# Altium schematic sheet 06_ACTUACION.SchDoc: Actuación: PhotoMOS K1 al EVSE
size 420 x 297 mm; Address1: Hardware en IoT · 2026; SheetNumber: 6; SheetTotal: 6
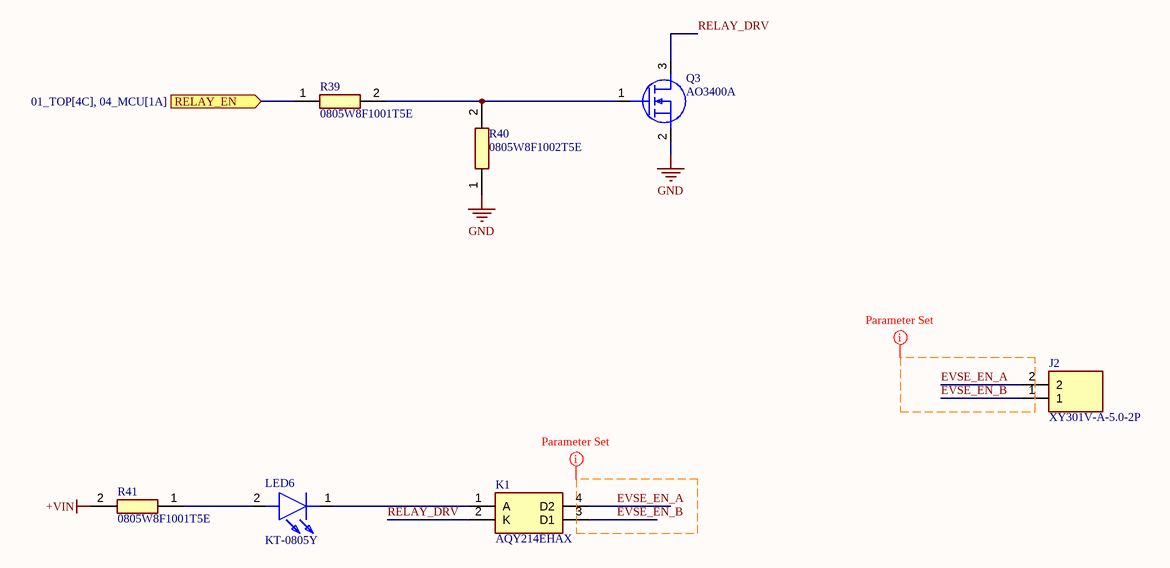
[diagram p0: 06_ACTUACION.SchDoc]

## Parts
J2  XY301V-A-5.0-2P  [TB001-500-02BE]
K1  AQY214EHAX  [SOP254P962X315-4N]
LED6  KT-0805Y  [LEDC2012X85N]
Q3  AO3400A  [SOT96P237X111-3N]
R39  0805W8F1001T5E  [RESC2012X60N]
R40  0805W8F1002T5E  [RESC2012X60N]
R41  0805W8F1001T5E  [RESC2012X60N]

## Ports
RELAY_EN (in, see 01_TOP[4C], 04_MCU[1A])

## Nets
+VIN: R41.2
GND: Q3.2(S) R40.1
EVSE_EN_A: J2.2 K1.4(D2)
EVSE_EN_B: J2.1 K1.3(D1)
RELAY_DRV: K1.2(K) Q3.3(D)
RELAY_EN: R39.1 ; port RELAY_EN
NetK1_1: K1.1(A) LED6.1(K)
NetLED6_2: LED6.2(A) R41.1
NetQ3_1: Q3.1(G) R39.2 R40.2

## Layout directives
net class EVSE_EXT: EVSE_EN_A, EVSE_EN_B

## Notes on the sheet
- CONTROL DE CARGA EVSE · HARDWARE EN IOT 2026
- DISEÑO: NICOLÁS GÓMEZ RAMÍREZ
- DWG NO:
- REVISION
- REV:
- DESCRIPTION
- DATE
- APPROVED
- ZONA DE RED 120–240 VAC CON AISLAMIENTO REFORZADO
- USO ACADÉMICO, SIN GARANTÍA.
- ENG:
- APPROVALS
- PROJECT
- DSN:
- CHK:
- REFERENCE DOCUMENTS
- PROJECT REVISION:
- TITLE
- DOCUMENT REVISION:
- DESIGN BY:
- BOM:
- FAB DWG:
- PCB DWG:
- ASSY DWG:
- SCALE:
- A3
- SIZE
- CAGE CODE
- FILE NAME
- DWG NO.
- SHEET
- OF
- REV

## Library data of the parts
J2 = XY301V-A-5.0-2P: Bornera de tornillo 2 polos, paso 5.0 mm, 300 V 15 A, 22-14 AWG; Manufacturer_Name: Xinlaiya; Assembly: JLCPCB; Value: 2P 5.0mm 300V; Manufacturer_Part_Number: XY301V-A-5.0-2P; Supplier: JLCPCB; Supplier PN: LCSC C557651
K1 = AQY214EHAX: PhotoMOS 1 Form A (NO), 400 V 120 mA, reinforced insulation 5000 Vrms, SMD DIP-4; Manufacturer_Name: Panasonic; Value: PhotoMOS NA; Assembly: JLCPCB; Manufacturer_Part_Number: AQY214EHAX; Supplier: JLCPCB; Supplier PN: LCSC C371971
LED6 = KT-0805Y: LED yellow 0805, 590 nm; Manufacturer_Name: Hubei KENTO Electronic; Assembly: JLCPCB; Value: amarillo; Manufacturer_Part_Number: KT-0805Y; Supplier: JLCPCB; Supplier PN: LCSC C2296; Datasheet Link: https://www.lcsc.com/datasheet/C2296.pdf
Q3 = AO3400A: MOSFET N-channel 30V 5.7A, Rds(on) 48mR max at Vgs 2.5V, SOT-23; Manufacturer_Name: Alpha & Omega Semiconductor; Value: NMOS 30V 5.7A; Assembly: JLCPCB; Supplier: JLCPCB; Supplier PN: LCSC C20917; Datasheet Link: https://www.aosmd.com/res/datasheets/AO3400A.pdf; Manufacturer_Part_Number: AO3400A
R39 R41 = 0805W8F1001T5E: Resistor 1 kOhm 1% 125 mW 0805; Manufacturer_Name: UNI-ROYAL; Assembly: JLCPCB; Value: 1k; Manufacturer_Part_Number: 0805W8F1001T5E; Supplier: JLCPCB; Supplier PN: LCSC C17513
R40 = 0805W8F1002T5E: Resistor 10 kOhm 1% 125 mW 0805; Manufacturer_Name: UNI-ROYAL; Value: 10k; Assembly: JLCPCB; Manufacturer_Part_Number: 0805W8F1002T5E; Supplier: JLCPCB; Supplier PN: LCSC C17414